# Altium project Main_Board_2.0.PrjPcb (part 1 of 4)
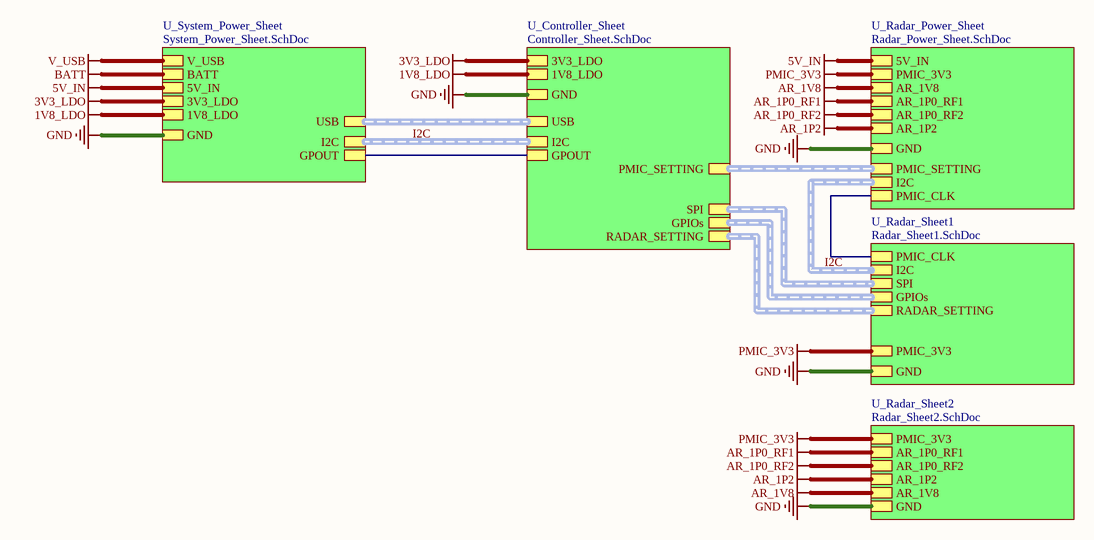
[diagram p0: Top_Sheet.SchDoc]
6 sheets, 225 parts. Net scope: hierarchical (ports join the sheet entries above them; power ports are global).
Board file: PCB_Main_Board_v2.0.PcbDoc
Sheets:
  Top_Sheet.SchDoc
    U_Radar_Power_Sheet = Radar_Power_Sheet.SchDoc
    U_Radar_Sheet2 = Radar_Sheet2.SchDoc
    U_System_Power_Sheet = System_Power_Sheet.SchDoc
    U_Controller_Sheet = Controller_Sheet.SchDoc
    U_Radar_Sheet1 = Radar_Sheet1.SchDoc

## Sheet Top_Sheet.SchDoc
size 420 x 297 mm; SheetNumber: 1; SheetTotal: 6

### Sub-sheets
U_Controller_Sheet = Controller_Sheet.SchDoc: USB (harness USB), GND, 3V3_LDO, 1V8_LDO, GPIOs (harness GPIOs), SPI (harness SPI), PMIC_SETTING (harness PMIC_SETTING), GPOUT, RADAR_SETTING (harness RADAR_SETTING), I2C (harness I2C)
U_Radar_Power_Sheet = Radar_Power_Sheet.SchDoc: I2C (harness I2C), GND, 5V_IN, AR_1P0_RF1, PMIC_3V3, AR_1P2, AR_1P0_RF2, AR_1V8, PMIC_SETTING (harness PMIC_SETTING), PMIC_CLK
U_Radar_Sheet1 = Radar_Sheet1.SchDoc: GPIOs (harness GPIOs), I2C (harness I2C), SPI (harness SPI), PMIC_3V3, GND, PMIC_CLK, RADAR_SETTING (harness RADAR_SETTING)
U_Radar_Sheet2 = Radar_Sheet2.SchDoc: GND, AR_1P0_RF1, PMIC_3V3, AR_1P2, AR_1P0_RF2, AR_1V8
U_System_Power_Sheet = System_Power_Sheet.SchDoc: USB (harness USB), I2C (harness I2C), GND, BATT, V_USB, 3V3_LDO, 5V_IN, 1V8_LDO, GPOUT

### Nets
1V8_LDO: sheet U_System_Power_Sheet/1V8_LDO, sheet U_Controller_Sheet/1V8_LDO
3V3_LDO: sheet U_System_Power_Sheet/3V3_LDO, sheet U_Controller_Sheet/3V3_LDO
5V_IN: sheet U_Radar_Power_Sheet/5V_IN, sheet U_System_Power_Sheet/5V_IN
AR_1P0_RF1: sheet U_Radar_Power_Sheet/AR_1P0_RF1, sheet U_Radar_Sheet2/AR_1P0_RF1
AR_1P0_RF2: sheet U_Radar_Power_Sheet/AR_1P0_RF2, sheet U_Radar_Sheet2/AR_1P0_RF2
AR_1P2: sheet U_Radar_Power_Sheet/AR_1P2, sheet U_Radar_Sheet2/AR_1P2
AR_1V8: sheet U_Radar_Power_Sheet/AR_1V8, sheet U_Radar_Sheet2/AR_1V8
GND: sheet U_Radar_Power_Sheet/GND, sheet U_Radar_Sheet2/GND, sheet U_System_Power_Sheet/GND, sheet U_Controller_Sheet/GND, sheet U_Radar_Sheet1/GND
PMIC_3V3: sheet U_Radar_Power_Sheet/PMIC_3V3, sheet U_Radar_Sheet2/PMIC_3V3, sheet U_Radar_Sheet1/PMIC_3V3
GPOUT: sheet U_System_Power_Sheet/GPOUT, sheet U_Controller_Sheet/GPOUT
PMIC_CLK: sheet U_Radar_Power_Sheet/PMIC_CLK, sheet U_Radar_Sheet1/PMIC_CLK

### Buses and harness runs
harness I2C = sheet U_Controller_Sheet/I2C = sheet U_System_Power_Sheet/I2C
harness I2C = sheet U_Radar_Power_Sheet/I2C = sheet U_Radar_Sheet1/I2C
harness sheet U_Controller_Sheet/GPIOs = sheet U_Radar_Sheet1/GPIOs
harness sheet U_Controller_Sheet/PMIC_SETTING = sheet U_Radar_Power_Sheet/PMIC_SETTING
harness sheet U_Controller_Sheet/RADAR_SETTING = sheet U_Radar_Sheet1/RADAR_SETTING
harness sheet U_Controller_Sheet/SPI = sheet U_Radar_Sheet1/SPI
harness sheet U_Controller_Sheet/USB = sheet U_System_Power_Sheet/USB

### Notes on the sheet
- File:
- Title:
- Date:
- Page
- Num:
- Total:
- Drawn By: Huzaifa Ali

## Sheet Radar_Power_Sheet.SchDoc
size 420 x 297 mm; SheetNumber: 3; SheetTotal: 6
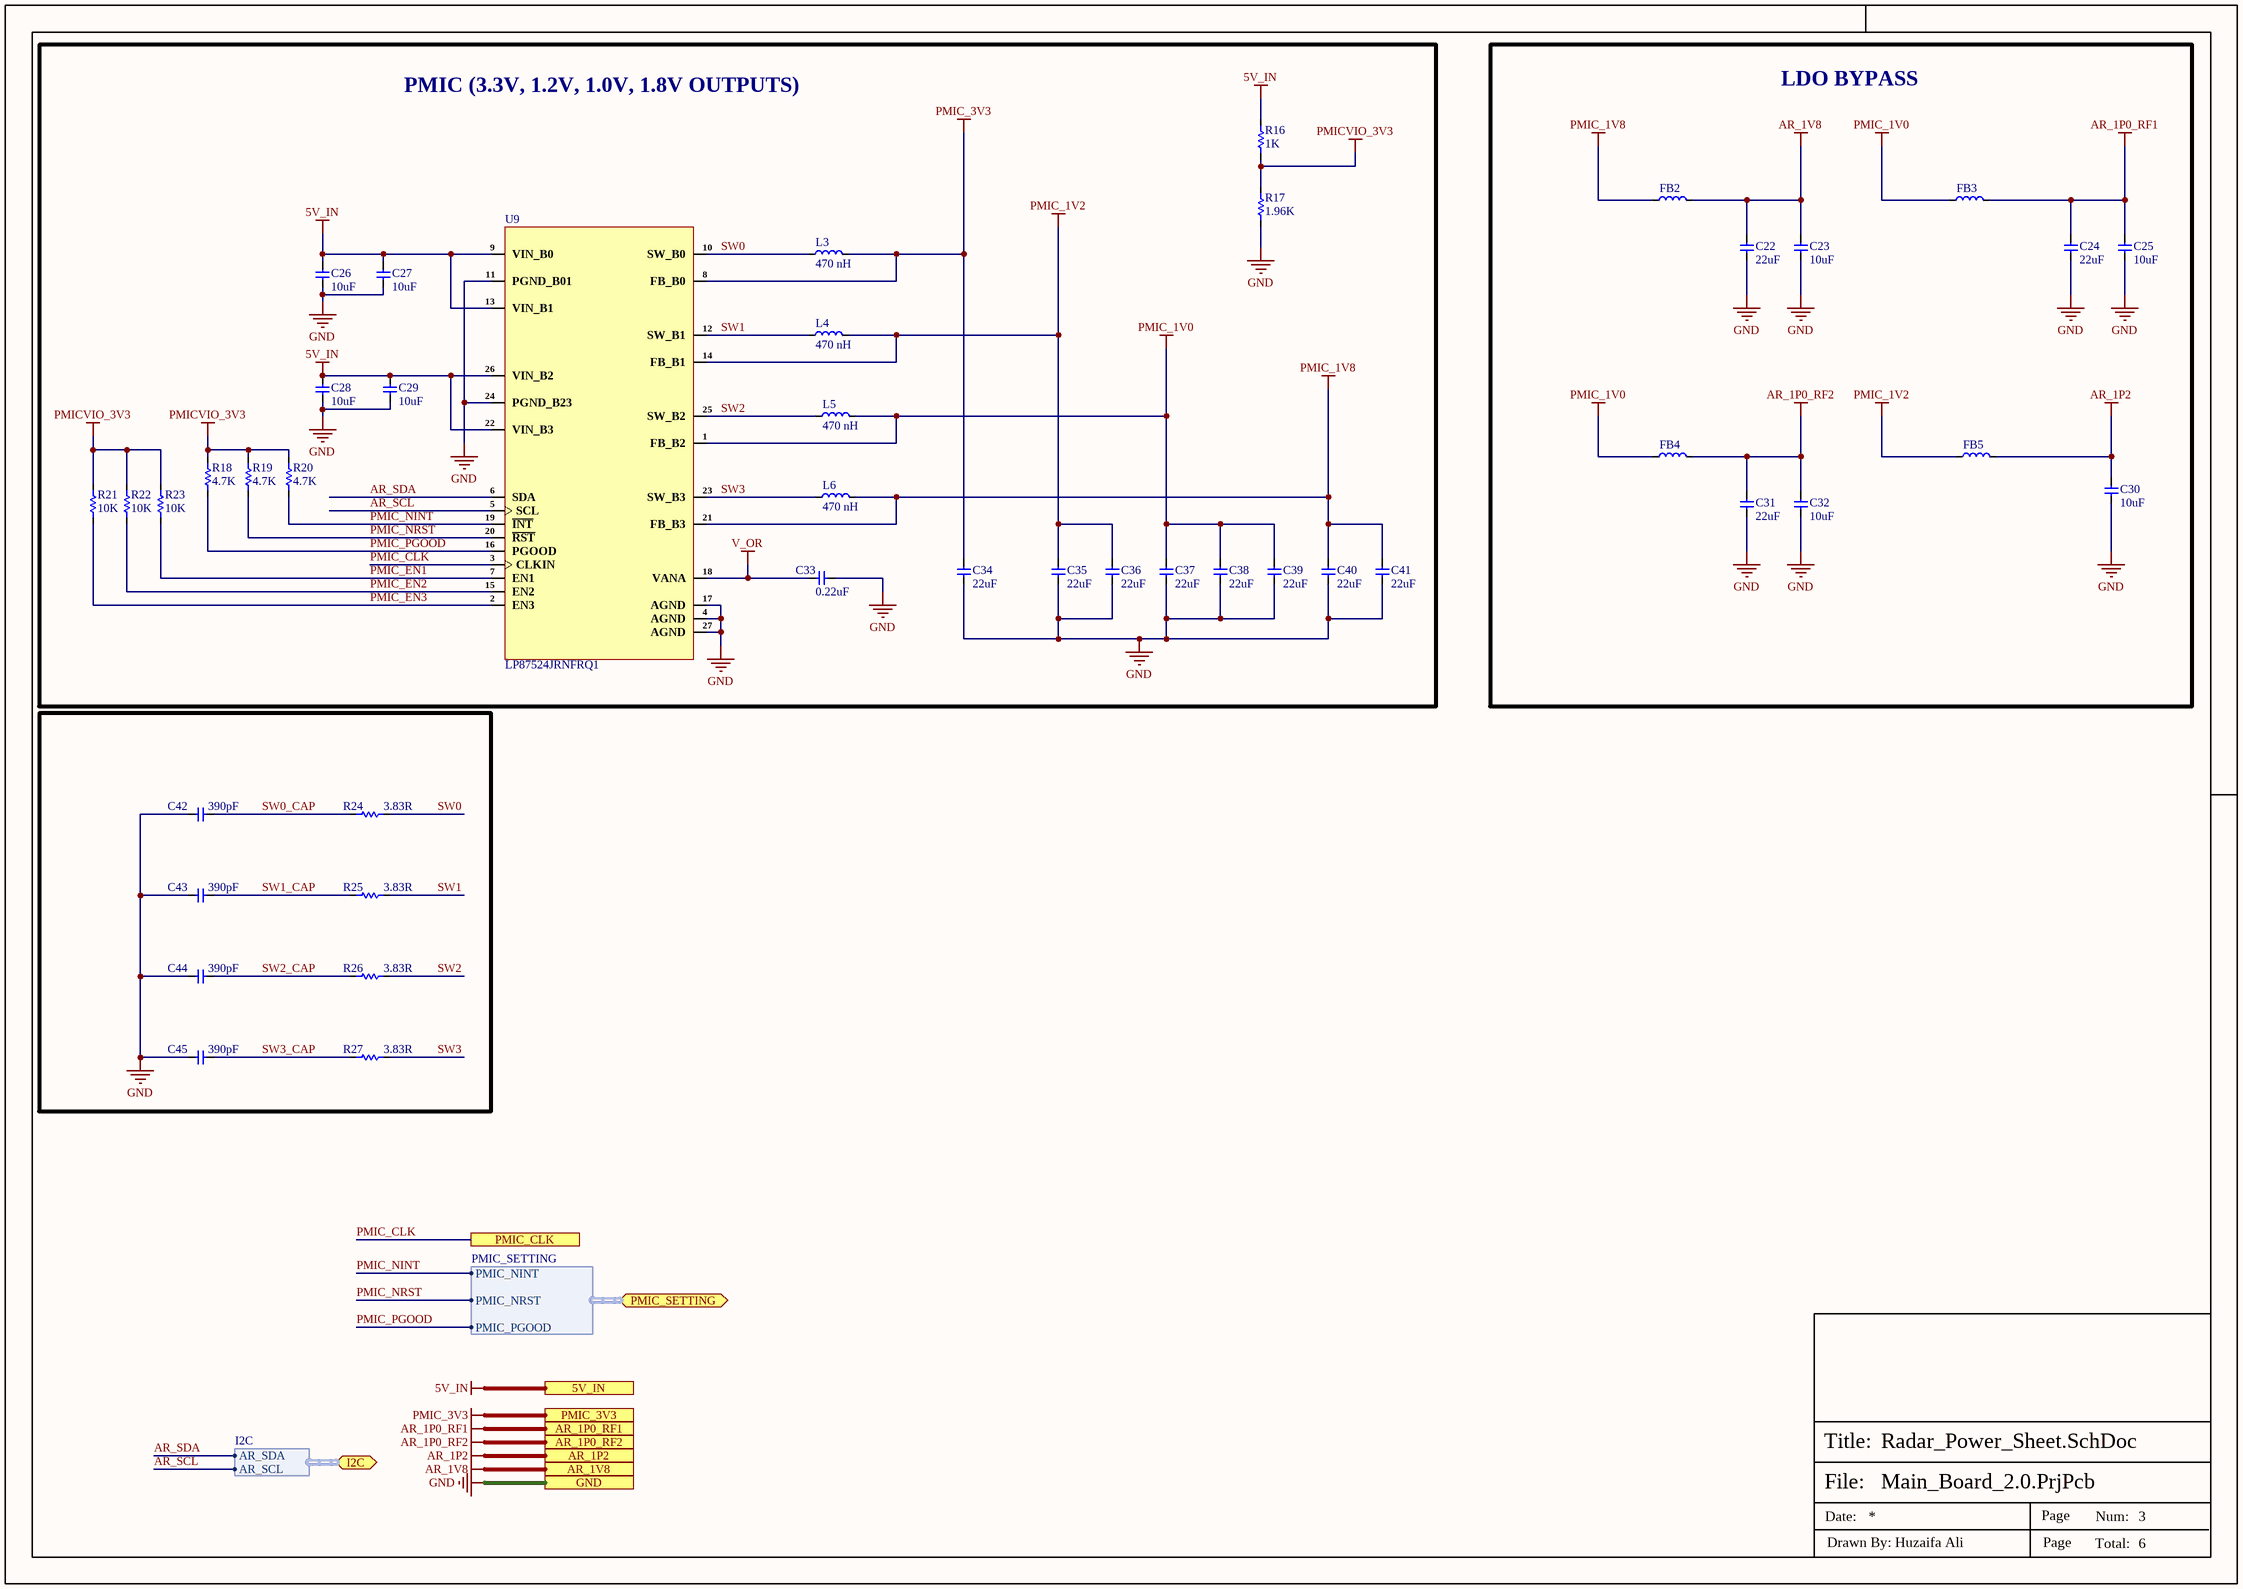
[diagram p1: Radar_Power_Sheet.SchDoc]

### Parts
C22  22uF  [Cap-1206]
C23  10uF  [Cap-0603]
C24  22uF  [Cap-1206]
C25  10uF  [Cap-0603]
C26  10uF  [Cap-0603]
C27  10uF  [Cap-0603]
C28  10uF  [Cap-0603]
C29  10uF  [Cap-0603]
C30  10uF  [Cap-0603]
C31  22uF  [Cap-1206]
C32  10uF  [Cap-0603]
C33  0.22uF  [Cap-0402]
C34  22uF  [Cap-1206]
C35  22uF  [Cap-1206]
C36  22uF  [Cap-1206]
C37  22uF  [Cap-1206]
C38  22uF  [Cap-1206]
C39  22uF  [Cap-1206]
C40  22uF  [Cap-1206]
C41  22uF  [Cap-1206]
C42  390pF  [Cap-0402]
C43  390pF  [Cap-0402]
C44  390pF  [Cap-0402]
C45  390pF  [Cap-0402]
FB2  100MHz  [IND-0603 (1608 Metric)]  (value not drawn)
FB3  100MHz  [IND-0603 (1608 Metric)]  (value not drawn)
FB4  100MHz  [IND-0603 (1608 Metric)]  (value not drawn)
FB5  100MHz  [IND-0603 (1608 Metric)]  (value not drawn)
L3  470 nH  [IND-1008 (2520 Metric)]
L4  470 nH  [IND-1008 (2520 Metric)]
L5  470 nH  [IND-1008 (2520 Metric)]
L6  470 nH  [IND-1008 (2520 Metric)]
R16  1K  [Res-0201]
R17  1.96K  [Res-0603]
R18  4.7K  [Res-0402]
R19  4.7K  [Res-0402]
R20  4.7K  [Res-0402]
R21  10K  [Res-0402]
R22  10K  [Res-0402]
R23  10K  [Res-0402]
R24  3.83R  [Res-0402]
R25  3.83R  [Res-0402]
R26  3.83R  [Res-0402]
R27  3.83R  [Res-0402]
U9  LP87524JRNFRQ1  [26-VQFN-HR (4.5x4)]

### Blocks framed on the sheet
PMIC (3.3V, 1.2V, 1.0V, 1.8V OUTPUTS): C26-C29 C33-C41 L3-L6 R16-R23 U9
LDO BYPASS: C22-C25 C30-C32 FB2-FB5

### Ports
5V_IN, AR_1P0_RF1, AR_1P0_RF2, AR_1P2, AR_1V8, GND, I2C (bidir, harness I2C), PMIC_3V3, PMIC_CLK, PMIC_SETTING (bidir, harness PMIC_SETTING)

### Harnesses
I2C: AR_SDA, AR_SCL
PMIC_SETTING: PMIC_NINT, PMIC_NRST, PMIC_PGOOD

### Nets
5V_IN: C26.2 C27.2 C28.2 C29.2 R16.1 U9.9(VIN_B0) U9.13(VIN_B1) U9.22(VIN_B3) U9.26(VIN_B2) ; port 5V_IN
AR_1P0_RF1: C24.2 C25.2 FB3.2 ; port AR_1P0_RF1
AR_1P0_RF2: C31.2 C32.2 FB4.2 ; port AR_1P0_RF2
AR_1P2: C30.2 FB5.2 ; port AR_1P2
AR_1V8: C22.2 C23.2 FB2.2 ; port AR_1V8
GND: C22.1 C23.1 C24.1 C25.1 C26.1 C27.1 C28.1 C29.1 C30.1 C31.1 C32.1 C33.2 C34.1 C35.1 C36.1 C37.1 C38.1 C39.1 C40.1 C41.1 C42.1 C43.1 C44.1 C45.1 R17.1 U9.4(AGND) U9.11(PGND_B01) U9.17(AGND) U9.24(PGND_B23) U9.27(AGND) ; port GND
PMIC_1V0: C37.2 C38.2 C39.2 FB3.1 FB4.1 L5.2 U9.1(FB_B2)
PMIC_1V2: C35.2 C36.2 FB5.1 L4.2 U9.14(FB_B1)
PMIC_1V8: C40.2 C41.2 FB2.1 L6.2 U9.21(FB_B3)
PMIC_3V3: C34.2 L3.2 U9.8(FB_B0) ; port PMIC_3V3
PMICVIO_3V3: R16.2 R17.2 R18.2 R19.2 R20.2 R21.2 R22.2 R23.2
V_OR: C33.1 U9.18(VANA)
AR_SCL: U9.5(SCL) ; port I2C.AR_SCL
AR_SDA: U9.6(SDA) ; port I2C.AR_SDA
PMIC_CLK: U9.3(CLKIN) ; port PMIC_CLK
PMIC_EN1: R23.1 U9.7(EN1)
PMIC_EN2: R22.1 U9.15(EN2)
PMIC_EN3: R21.1 U9.2(EN3)
PMIC_NINT: R20.1 U9.19(~{INT}) ; port PMIC_SETTING.PMIC_NINT
PMIC_NRST: R19.1 U9.20(~{RST}) ; port PMIC_SETTING.PMIC_NRST
PMIC_PGOOD: R18.1 U9.16(PGOOD) ; port PMIC_SETTING.PMIC_PGOOD
SW0: L3.1 R24.2 U9.10(SW_B0)
SW0_CAP: C42.2 R24.1
SW1: L4.1 R25.2 U9.12(SW_B1)
SW1_CAP: C43.2 R25.1
SW2: L5.1 R26.2 U9.25(SW_B2)
SW2_CAP: C44.2 R26.1
SW3: L6.1 R27.2 U9.23(SW_B3)
SW3_CAP: C45.2 R27.1

### Notes on the sheet
- File:
- Title:
- Date:
- Page
- Num:
- Total:
- Drawn By: Huzaifa Ali

### Library data of the parts
C22 C24 C31 C34-C41 = C3216X5R1E226M160AB: CAP CER 22UF 25V X5R 1206; Manufacturer: TDK; Dielectric Material: Ceramic; Tolerance: 20%; Item Type: Capacitor; Supplier 1: Digi-Key; Manufacturer Part Number: C3216X5R1E226M160AB; Stock 1: 21442; Pricing 1: 1=1.08, 10=0.822, 50=0.6832, 100=0.5882, 500=0.4554, 1000=0.39215 (USD); Mount: Surface Mount; Case/Package: 1206; Case Code (Metric): 3216; Case Code (Imperial): 1206; Weight: 0.000571oz; Min Operating Temperature: -55°C; Max Operating Temperature: 85°C; Voltage Rating: 25V; Capacitance: 22uF; Packaging: Tape and Reel; Voltage Rating (DC): 25V; Dielectric: X5R; Termination: SMD/SMT; Construction: Flat; Package Quantity: 1; Resistor Type: Ceramic; Series: C; Length: 3.2mm; Width: 0.063inch; Height: 1.6mm; Depth: 1.6mm; Thickness: 0.071inch; Lead Free: Lead Free; REACH SVHC: No SVHC; RoHS Compliant: Yes; ComponentLink1URL: https://product.tdk.com/info/en/documents/chara_sheet/C3216X5R1E226M160AB.pdf?src-supplier=Digi-Key; ComponentLink1Description: https://product.tdk.com/info/en/documents/chara_sheet/C3216X5R1E226M160AB.pdf?src-supplier=Digi-Key; ComponentLink2URL: http://www.mouser.com/ds/2/400/lcc_commercial_general_en-837201.pdf?src-supplier=Mouser; ComponentLink2Description: http://www.mouser.com/ds/2/400/lcc_commercial_general_en-837201.pdf?src-supplier=Mouser; Supplier Part Number 1: 445-6000-1-ND; LCSC Part Number: C2167811
C23 C25-C30 C32 = CC0603KRX5R7BB106: CAP CER 10UF 16V X5R 0603; Manufacturer: Yageo; Tolerance: 10%; Item Type: Capacitor; Supplier 1: Digi-Key; Manufacturer Part Number: CC0603KRX5R7BB106; RoHS: Yes; Category: Ceramic Capacitors; Stock 1: 240725; Pricing 1: 1=0.68000, 10=0.48000, 50=0.36300, 100=0.31610, 500=0.23416, 1000=0.19903 (USD); Mount: Surface Mount; Case/Package: 0603; Case Code (Imperial): 0603; Case Code (Metric): 1608; Min Operating Temperature: -55°C; Max Operating Temperature: 85°C; Packaging: Cut Tape; Capacitance: 10uF; Voltage Rating: 16V; RoHS Compliant: Yes; ComponentLink1URL: http://www.yageo.com/documents/recent/UPY-GPHC_X5R_4V-to-50V_25.pdf?src-supplier=Digi-Key; ComponentLink1Description: http://www.yageo.com/documents/recent/UPY-GPHC_X5R_4V-to-50V_25.pdf?src-supplier=Digi-Key; Supplier Part Number 1: 311-3486-1-ND; LCSC Part Number: C2936601
C33 = CC0402KRX5R8BB224: CAP CER 0.22UF 25V X5R 0402; Manufacturer: Yageo; Capacitance: 220nF; Tolerance: 10%; Supplier 1: Mouser; Manufacturer Part Number: CC0402KRX5R8BB224; RoHS: Yes; Category: Ceramic Capacitors; Stock 1: 61266; Pricing 1: 1=0.10000, 10=0.03300, 50=0.03300, 100=0.02700, 1000=0.01500, 10000=0.01300 (USD); Mount: Surface Mount; Case/Package: 0402; Min Operating Temperature: -55°C; Max Operating Temperature: 85°C; Packaging: Tape and Reel; Voltage Rating: 25V; Voltage Rating (DC): 25V; Dielectric: X5R; Length: 0.039inch; Width: 0.02inch; Thickness: 0.022inch; Lead Free: Lead Free; Halogen Free: Halogen Free; RoHS Compliant: Yes; ComponentLink1URL: http://www.yageo.com/documents/recent/UPY-GPHC_X5R_4V-to-50V_25.pdf?src-supplier=Digi-Key; ComponentLink1Description: http://www.yageo.com/documents/recent/UPY-GPHC_X5R_4V-to-50V_25.pdf?src-supplier=Digi-Key; ComponentLink2URL: https://www.yageo.com/upload/media/product/productsearch/datasheet/mlcc/UPY-GPHC_X5R_4V-to-50V_26.pdf?src-supplier=Digi-Key; ComponentLink2Description: https://www.yageo.com/upload/media/product/productsearch/datasheet/mlcc/UPY-GPHC_X5R_4V-to-50V_26.pdf?src-supplier=Digi-Key; ComponentLink3URL: http://www.yageo.com/documents/recent/UPY-GPHC_X5R_4V-to-50V_23.pdf?src-supplier=Digi-Key; ComponentLink3Description: http://www.yageo.com/documents/recent/UPY-GPHC_X5R_4V-to-50V_23.pdf?src-supplier=Digi-Key; Supplier Part Number 1: 603-CC402KRX5R8BB224; LCSC Part Number: C326836
C42-C45 = CGA2B2C0G1H391J050BA: CAP CER 390PF 50V C0G 0402; Manufacturer: TDK; Item Type: apacitors; Supplier: Digikey; Supplier Part Number: 445-5603-1-ND; Manufacturer Part Number: CGA2B2C0G1H391J050BA; RoHS: Yes; Stock: 103846; Pricing: 1=0.1, 10=0.048, 50=0.0278, 100=0.0216, 500=0.01622, 1000=0.01275, 2500=0.01159, 5000=0.01066 (USD); ComponentLink1URL: https://datasheet.ciiva.com/24219/cga2b2c0g1h391j050ba-265720-24219960.pdf?src-supplier=Mouser; ComponentLink1Description: https://datasheet.ciiva.com/24219/cga2b2c0g1h391j050ba-265720-24219960.pdf?src-supplier=Mouser; ComponentLink2URL: https://datasheet.ciiva.com/7975/1807242-7975259.pdf?src-supplier=Element14; ComponentLink2Description: https://datasheet.ciiva.com/7975/1807242-7975259.pdf?src-supplier=Element14
FB2-FB5 = BLM18SP101SZ1D: FERRITE BEAD 100 OHM 0603 1LN; Manufacturer: Murata; Max Current Rating: 3.7A; Number of Lines: 1; Supplier: Rs; Supplier Part Number: 2234942; Manufacturer Part Number: BLM18SP101SZ1D; RoHS: Yes; Category: Ferrite Beads and Chips; Stock: 1800; Pricing: 100=0.065, 500=0.059, 1000=0.048, 2000=0.044 (GBP); Mounting Technology: Surface Mount; Case/Package: 0603; Min Operating Temperature: -55°C; Max Operating Temperature: 125°C; Series: BLM; Ratings: AEC-Q200; LCSC Part Number: C1512136; Item Type: Ferrite Bead
L3-L6 = DFE252012PD-R47M=P2: FIXED IND 470NH 4A 0.027OHM SMD; Manufacturer: Murata; Item Type: Fixed Inductors; Inductance Tolerance: 20%; Saturation Current: 5.2A; ESR: 27mR; Test Frequency: 1MHz; Supplier: Mouser; Supplier Part Number: 81-DFE252012PDR47MP2; Manufacturer Part Number: DFE252012PD-R47M=P2; RoHS: Yes; Stock: 74061; Pricing: 1=0.48, 10=0.342, 50=0.342, 100=0.249, 1000=0.217, 10000=0.201 (USD); Min Operating Temperature: -40°C; Max Operating Temperature: 125°C; Current Rating: 4A; Value: 470nH; RMS Current (Irms): 4A; Tolerance: 20%; Height: 1.2mm; RoHS Compliant: Yes; ComponentLink1URL: http://www.farnell.com/datasheets/2616814.pdf?src-supplier=Farnell; ComponentLink1Description: http://www.farnell.com/datasheets/2616814.pdf?src-supplier=Farnell; ComponentLink2URL: https://search.murata.co.jp/Ceramy/image/img/P02/J(E)TE243A-9102.pdf?src-supplier=Digikey; ComponentLink2Description: https://search.murata.co.jp/Ceramy/image/img/P02/J(E)TE243A-9102.pdf?src-supplier=Digikey; ComponentLink3URL: http://www.farnell.com/datasheets/2616814.pdf?src-supplier=Newark; ComponentLink3Description: http://www.farnell.com/datasheets/2616814.pdf?src-supplier=Newark
R16 = RC0201FR-071KL: RES 1K OHM 1% 1/20W 0201; Manufacturer: Yageo; Value: 1kR; Temperature Coefficient: 200ppm/°C; Power Rating: 50mW; Voltage Rating: 25V; Item Type: Resistor; Supplier: Digi-Key; Supplier Part Number: 311-1KMCT-ND; Manufacturer Part Number: RC0201FR-071KL; RoHS: Yes; Category: Chip SMD Resistors; Stock: 5606340; Pricing: 1=0.1, 10=0.027, 50=0.0172, 100=0.0143, 500=0.00988, 1000=0.00854, 5000=0.00629 (USD); Case/Package: 0201; Contact Plating: Tin,Matte; Case Code (Metric): 0603; Case Code (Imperial): 0201; Min Operating Temperature: -55°C; Max Operating Temperature: 125°C; Tolerance: 1%; Resistor Type: Thick Film; Package Quantity: 10000; Packaging: Tape and Reel; Number of Terminations: 2; Termination: SMD/SMT; Max Power Dissipation: 50mW; Working Voltage: 25V; Features: Moisture Resistant; Series: RC; Resistance Tolerance: 1%; Technology: THICK FILM; Construction: Rectangular; Voltage Rating (DC): 25V; Length: 0.024inch; Width: 0.012inch; Height: 0.01inch; Depth: 0.3mm; Military Standard: Not; RoHS Compliant: Yes; Reach SVHC Compliant: Unknown; Lead Free: 5697LeadFree; ComponentLink1URL: https://datasheet.ciiva.com/7672/1563626-7672204.pdf?src-supplier=Element14; ComponentLink1Description: https://datasheet.ciiva.com/7672/1563626-7672204.pdf?src-supplier=Element14; ComponentLink2URL: https://datasheet.ciiva.com/22698/1563626-22698505.pdf?src-supplier=Element14; ComponentLink2Description: https://datasheet.ciiva.com/22698/1563626-22698505.pdf?src-supplier=Element14; ComponentLink3URL: https://datasheet.ciiva.com/29721/pyu-r-int-thick-7-29721196.pdf?src-supplier=Digi-Key; ComponentLink3Description: https://datasheet.ciiva.com/29721/pyu-r-int-thick-7-29721196.pdf?src-supplier=Digi-Key; ComponentLink4URL: https://datasheet.ciiva.com/29721/pyu-r-int-thick-7-29721195.pdf?src-supplier=Digi-Key; ComponentLink4Description: https://datasheet.ciiva.com/29721/pyu-r-int-thick-7-29721195.pdf?src-supplier=Digi-Key; ComponentLink5URL: https://datasheet.ciiva.com/8896/pyu-rc0201-51-rohs-l-8-8896174.pdf?src-supplier=Avnet; ComponentLink5Description: https://datasheet.ciiva.com/8896/pyu-rc0201-51-rohs-l-8-8896174.pdf?src-supplier=Avnet; LCSC Part Number: C138165
R17 = RC0603FR-071K96L: RES 1.96K OHM 1% 1/10W 0603; Manufacturer: Yageo; Value: 1.96kR; Power Rating: 100mW; Voltage Rating: 75V; Temperature Coefficient: 100ppm/°C; Voltage Rating (DC): 50V; Supplier: Future Electronics; Supplier Part Number: 4765236; Manufacturer Part Number: RC0603FR-071K96L; RoHS: Yes; Category: Chip SMD Resistors; Stock: 30000; Pricing: 5000=0.0015, 50000=0.0014, 150000=0.0014, 375000=0.0013, 1000000=0.0012 (USD); Case/Package: 0603; Case Code (Metric): 1608; Case Code (Imperial): 0603; Weight: 7.1E-05oz; Min Operating Temperature: -55°C; Max Operating Temperature: 155°C; Tolerance: 1%; Packaging: Tape and Reel; Number of Terminations: 2; Termination: SMD/SMT; Max Power Dissipation: 100mW; Features: Moisture Resistant; Series: RC; Construction: Rectangular; Length: 1.6mm; Width: 0.8mm; Height: 0.45mm; Depth: 0.8mm; Military Standard: Not; Lead Free: Lead Free; RoHS Compliant: Yes; ComponentLink1URL: https://datasheet.ciiva.com/2508/pyu-r-int-thick-7-2508485.pdf?src-supplier=Digikey; ComponentLink1Description: https://datasheet.ciiva.com/2508/pyu-r-int-thick-7-2508485.pdf?src-supplier=Digikey; ComponentLink2URL: https://datasheet.ciiva.com/2508/pyu-r-int-thick-7-2508486.pdf?src-supplier=Digikey; ComponentLink2Description: https://datasheet.ciiva.com/2508/pyu-r-int-thick-7-2508486.pdf?src-supplier=Digikey; ComponentLink3URL: https://datasheet.ciiva.com/2508/pyu-r-int-thick-7-2508487.pdf?src-supplier=Digikey; ComponentLink3Description: https://datasheet.ciiva.com/2508/pyu-r-int-thick-7-2508487.pdf?src-supplier=Digikey; ComponentLink4URL: https://datasheet.ciiva.com/15189/getdatasheetpartid-327907-15189642.pdf?src-supplier=Verical; ComponentLink4Description: https://datasheet.ciiva.com/15189/getdatasheetpartid-327907-15189642.pdf?src-supplier=Verical
R18-R20 = RC0402FR-074K7L: RES 4.7K OHM 1% 1/16W 0402; Manufacturer: Yageo; Voltage Rating (DC): 50V; Power Rating: 62.5mW; Resistance: 4.7kR; Temperature Coefficient: 100ppm/°C; Max Power Dissipation: 63mW; Item Type: Resistor; Supplier 1: Avnet; Manufacturer Part Number: RC0402FR-074K7L; RoHS: Yes; Category: Chip SMD Resistors; Stock 1: 2420000; Pricing 1: 10000=0.00085 (USD); Case/Package: 0402; Number of Pins: 2; Case Code (Imperial): 0402; Case Code (Metric): 1005; Size Code: 0402; Min Operating Temperature: -55°C; Max Operating Temperature: 155°C; Tolerance: 1%; Voltage Rating: 50V; Packaging: Tape and Reel; Resistor Type: Thick Film; Termination: SMD/SMT; Features: Moisture Resistant; Series: RC; Number of Terminations: 2; Resistance Tolerance: 1%; Construction: Rectangular; Length: 1mm; Width: 0.5mm; Height: 0.32mm; Depth: 0.5mm; Height - Seated (Max): 0.016inch; RoHS Compliant: Yes; Reach SVHC Compliant: Yes; Military Standard: Not; Lead Free: Lead Free; ComponentLink1URL: https://datasheet.ciiva.com/22661/1686128-22661342.pdf?src-supplier=Element14; ComponentLink1Description: https://datasheet.ciiva.com/22661/1686128-22661342.pdf?src-supplier=Element14; ComponentLink2URL: https://datasheet.ciiva.com/7850/1018594-7850022.pdf?src-supplier=Element14; ComponentLink2Description: https://datasheet.ciiva.com/7850/1018594-7850022.pdf?src-supplier=Element14; ComponentLink3URL: https://datasheet.ciiva.com/7850/1018594-7850023.pdf?src-supplier=Element14; ComponentLink3Description: https://datasheet.ciiva.com/7850/1018594-7850023.pdf?src-supplier=Element14; ComponentLink4URL: https://datasheet.ciiva.com/15215/getdatasheetpartid-328119-15215035.pdf?src-supplier=Verical; ComponentLink4Description: https://datasheet.ciiva.com/15215/getdatasheetpartid-328119-15215035.pdf?src-supplier=Verical; Supplier Part Number 1: RC0402FR-074K7L; LCSC Part Number: C105871
R21-R23 = RC0402FR-0710KL: RES 10K OHM 1% 1/16W 0402; Manufacturer: Yageo; Resistance: 10kR; Voltage Rating (DC): 50V; Temperature Coefficient: 100ppm/°C; Power Rating: 62.5mW; Max Power Dissipation: 63mW; Item Type: Resistor; Supplier 1: Mouser; Manufacturer Part Number: RC0402FR-0710KL; RoHS: Yes; Category: Chip SMD Resistors; Stock 1: 18648329; Pricing 1: 1=0.10000, 10=0.01400, 50=0.01400, 100=0.00500, 1000=0.00300, 10000=0.00200 (USD); Case/Package: 0402; Number of Pins: 2; Case Code (Imperial): 0402; Case Code (Metric): 1005; Min Operating Temperature: -55°C; Max Operating Temperature: 155°C; Resistor Type: Thick Film; Tolerance: 1%; Packaging: Tape and Reel; Voltage Rating: 50V; Termination: SMD/SMT; Working Voltage: 50V; Number of Terminations: 2; Features: Moisture Resistant; Series: RC; Resistance Tolerance: 1%; Construction: Rectangular; Length: 1mm; Width: 0.5mm; Height: 0.32mm; Depth: 0.5mm; Lead Pitch: 0.2mm; REACH SVHC: No SVHC; Lead Free: Lead Free; RoHS Compliant: Yes; Military Standard: Not; ComponentLink1URL: https://datasheet.ciiva.com/7660/38568-7660787.pdf?src-supplier=Element14; ComponentLink1Description: https://datasheet.ciiva.com/7660/38568-7660787.pdf?src-supplier=Element14; ComponentLink2URL: https://datasheet.ciiva.com/7849/1686128-7849814.pdf?src-supplier=Element14; ComponentLink2Description: https://datasheet.ciiva.com/7849/1686128-7849814.pdf?src-supplier=Element14; ComponentLink3URL: https://datasheet.ciiva.com/7983/1018594-7983486.pdf?src-supplier=Element14; ComponentLink3Description: https://datasheet.ciiva.com/7983/1018594-7983486.pdf?src-supplier=Element14; ComponentLink4URL: https://datasheet.ciiva.com/22747/1018594-22747512.pdf?src-supplier=Element14; ComponentLink4Description: https://datasheet.ciiva.com/22747/1018594-22747512.pdf?src-supplier=Element14; ComponentLink5URL: https://datasheet.ciiva.com/12667/pyu-rc0402-51-rohs-l-6-r-12667067.pdf?src-supplier=Mouser; ComponentLink5Description: https://datasheet.ciiva.com/12667/pyu-rc0402-51-rohs-l-6-r-12667067.pdf?src-supplier=Mouser; ComponentLink6URL: https://datasheet.ciiva.com/7849/1784430-7849813.pdf?src-supplier=Element14; ComponentLink6Description: https://datasheet.ciiva.com/7849/1784430-7849813.pdf?src-supplier=Element14; ComponentLink7URL: https://datasheet.ciiva.com/7849/1784430-7849815.pdf?src-supplier=Element14; ComponentLink7Description: https://datasheet.ciiva.com/7849/1784430-7849815.pdf?src-supplier=Element14; Supplier Part Number 1: 603-RC0402FR-0710KL; LCSC Part Number: C60490
R24-R27 = CRCW04023R83FKED: RES SMD 3.83 OHM 1% 1/16W 0402; Manufacturer: Vishay Dale; Item Type: Resistors; Voltage Rating (DC): 50V; Supplier: Mouser; Supplier Part Number: 71-CRCW04023R83FKED; Manufacturer Part Number: CRCW04023R83FKED; RoHS: Yes; Stock: 23660; Pricing: 1=0.1, 10=0.023, 50=0.023, 100=0.013, 1000=0.01, 10000=0.005 (USD); ComponentLink1URL: https://datasheet.ciiva.com/2464/dcrcwe3-2464766.pdf?src-supplier=Digikey; ComponentLink1Description: https://datasheet.ciiva.com/2464/dcrcwe3-2464766.pdf?src-supplier=Digikey; ComponentLink2URL: https://datasheet.ciiva.com/2464/dcrcwe3-2464767.pdf?src-supplier=Digikey; ComponentLink2Description: https://datasheet.ciiva.com/2464/dcrcwe3-2464767.pdf?src-supplier=Digikey; ComponentLink3URL: https://datasheet.ciiva.com/2464/dcrcwe3-2464765.pdf?src-supplier=Digikey; ComponentLink3Description: https://datasheet.ciiva.com/2464/dcrcwe3-2464765.pdf?src-supplier=Digikey; ComponentLink4URL: https://datasheet.ciiva.com/9076/dcrcwe3-9076442.pdf?src-supplier=Avnet; ComponentLink4Description: https://datasheet.ciiva.com/9076/dcrcwe3-9076442.pdf?src-supplier=Avnet
U9 = LP87524JRNFRQ1: IC REG BUCK ADJ QUAD 26VQFN; Manufacturer: Texas Instruments; Supplier: Mouser; Supplier Part Number: 595-LP87524JRNFRQ1; Manufacturer Part Number: LP87524JRNFRQ1; RoHS: Yes; Item Type: IC; Stock: 3780; Pricing: 1=5.94, 10=5.2, 50=5.2, 100=4.37, 1000=3.14, 10000=2.91 (USD); Pins: 26NUMBER; Thickness: 900um; ComponentLink1URL: http://www.ti.com/general/docs/suppproductinfo.tsp?distId=10&amp;gotoUrl=http%3A%2F%2Fwww.ti.com%2Flit%2Fgpn%2Flp87524j-q1&src-supplier=Digikey; ComponentLink1Description: http://www.ti.com/general/docs/suppproductinfo.tsp?distId=10&amp;gotoUrl=http%3A%2F%2Fwww.ti.com%2Flit%2Fgpn%2Flp87524j-q1&src-supplier=Digikey

## Sheet Radar_Sheet2.SchDoc
size 420 x 297 mm; SheetNumber: 5; SheetTotal: 6
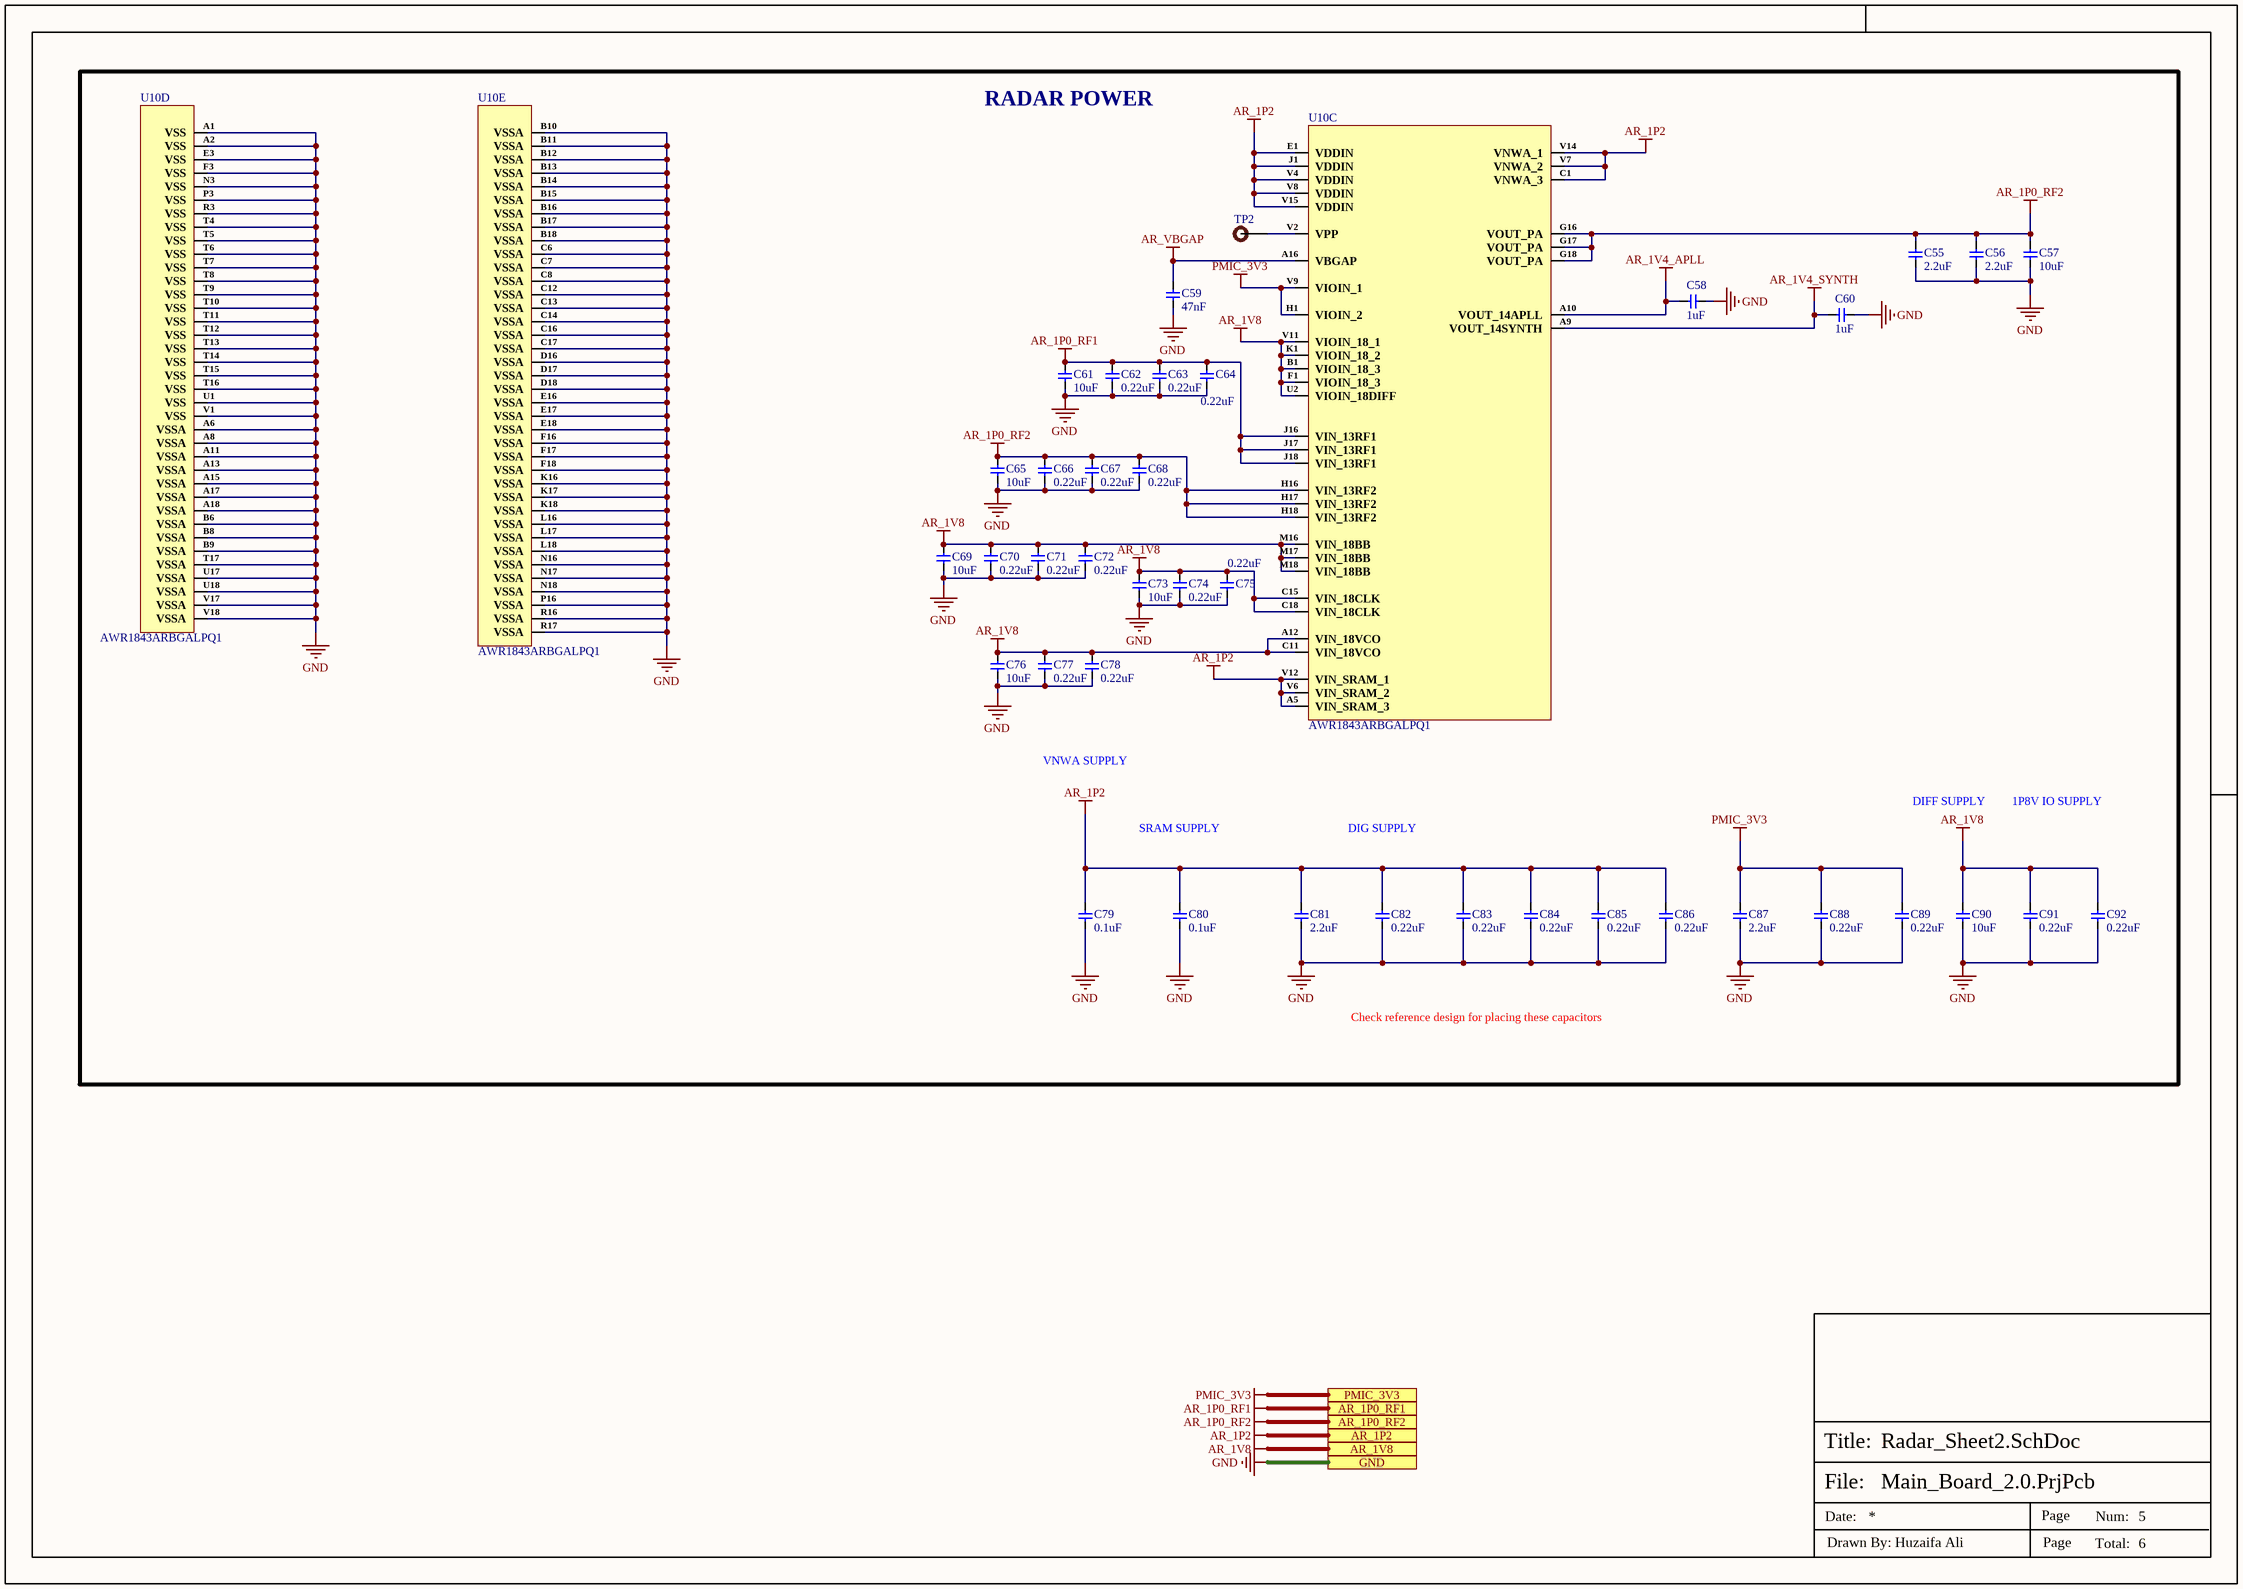
[diagram p2: Radar_Sheet2.SchDoc]

### Parts
C55  2.2uF  [CAP-0603]
C56  2.2uF  [CAP-0603]
C57  10uF  [Cap-0603]
C58  1uF  [Cap-0402]
C59  47nF  [Cap-0402]
C60  1uF  [Cap-0402]
C61  10uF  [Cap-0603]
C62  0.22uF  [Cap-0402]
C63  0.22uF  [Cap-0402]
C64  0.22uF  [Cap-0402]
C65  10uF  [Cap-0603]
C66  0.22uF  [Cap-0402]
C67  0.22uF  [Cap-0402]
C68  0.22uF  [Cap-0402]
C69  10uF  [Cap-0603]
C70  0.22uF  [Cap-0402]
C71  0.22uF  [Cap-0402]
C72  0.22uF  [Cap-0402]
C73  10uF  [Cap-0603]
C74  0.22uF  [Cap-0402]
C75  0.22uF  [Cap-0402]
C76  10uF  [Cap-0603]
C77  0.22uF  [Cap-0402]
C78  0.22uF  [Cap-0402]
C79  0.1uF  [Cap-0402]
C80  0.1uF  [Cap-0402]
C81  2.2uF  [CAP-0603]
C82  0.22uF  [Cap-0402]
C83  0.22uF  [Cap-0402]
C84  0.22uF  [Cap-0402]
C85  0.22uF  [Cap-0402]
C86  0.22uF  [Cap-0402]
C87  2.2uF  [CAP-0603]
C88  0.22uF  [Cap-0402]
C89  0.22uF  [Cap-0402]
C90  10uF  [Cap-0603]
C91  0.22uF  [Cap-0402]
C92  0.22uF  [Cap-0402]
TP2  TEST POINT  [Test-point]  (value not drawn)  (no BOM)
U10  AWR1843ARBGALPQ1  [180-FCBGA (15x15)]  (parts C,D,E of 5)

### Ports
AR_1P0_RF1, AR_1P0_RF2, AR_1P2, AR_1V8, GND, PMIC_3V3

### Nets
AR_1P0_RF1: C61.2 C62.2 C63.2 C64.2 U10.J16(VIN_13RF1) U10.J17(VIN_13RF1) U10.J18(VIN_13RF1) ; port AR_1P0_RF1
AR_1P0_RF2: C55.2 C56.2 C57.2 C65.2 C66.2 C67.2 C68.2 U10.G16(VOUT_PA) U10.G17(VOUT_PA) U10.G18(VOUT_PA) U10.H16(VIN_13RF2) U10.H17(VIN_13RF2) U10.H18(VIN_13RF2) ; port AR_1P0_RF2
AR_1P2: C79.2 C80.2 C81.2 C82.2 C83.2 C84.2 C85.2 C86.2 U10.A5(VIN_SRAM_3) U10.C1(VNWA_3) U10.E1(VDDIN) U10.J1(VDDIN) U10.V4(VDDIN) U10.V6(VIN_SRAM_2) U10.V7(VNWA_2) U10.V8(VDDIN) U10.V12(VIN_SRAM_1) U10.V14(VNWA_1) U10.V15(VDDIN) ; port AR_1P2
AR_1V4_APLL: C58.2 U10.A10(VOUT_14APLL)
AR_1V4_SYNTH: C60.2 U10.A9(VOUT_14SYNTH)
AR_1V8: C69.2 C70.2 C71.2 C72.2 C73.2 C74.2 C75.2 C76.2 C77.2 C78.2 C90.2 C91.2 C92.2 U10.A12(VIN_18VCO) U10.B1(VIOIN_18_3) U10.C11(VIN_18VCO) U10.C15(VIN_18CLK) U10.C18(VIN_18CLK) U10.F1(VIOIN_18_3) U10.K1(VIOIN_18_2) U10.M16(VIN_18BB) U10.M17(VIN_18BB) U10.M18(VIN_18BB) U10.U2(VIOIN_18DIFF) U10.V11(VIOIN_18_1) ; port AR_1V8
AR_VBGAP: C59.2 U10.A16(VBGAP)
GND: C55.1 C56.1 C57.1 C58.1 C59.1 C60.1 C61.1 C62.1 C63.1 C64.1 C65.1 C66.1 C67.1 C68.1 C69.1 C70.1 C71.1 C72.1 C73.1 C74.1 C75.1 C76.1 C77.1 C78.1 C79.1 C80.1 C81.1 C82.1 C83.1 C84.1 C85.1 C86.1 C87.1 C88.1 C89.1 C90.1 C91.1 C92.1 U10.A1(VSS) U10.A2(VSS) U10.A6(VSSA) U10.A8(VSSA) U10.A11(VSSA) U10.A13(VSSA) U10.A15(VSSA) U10.A17(VSSA) U10.A18(VSSA) U10.B6(VSSA) U10.B8(VSSA) U10.B9(VSSA) U10.B10(VSSA) U10.B11(VSSA) U10.B12(VSSA) U10.B13(VSSA) U10.B14(VSSA) U10.B15(VSSA) U10.B16(VSSA) U10.B17(VSSA) U10.B18(VSSA) U10.C6(VSSA) U10.C7(VSSA) U10.C8(VSSA) U10.C12(VSSA) U10.C13(VSSA) U10.C14(VSSA) U10.C16(VSSA) U10.C17(VSSA) U10.D16(VSSA) U10.D17(VSSA) U10.D18(VSSA) U10.E3(VSS) U10.E16(VSSA) U10.E17(VSSA) U10.E18(VSSA) U10.F3(VSS) U10.F16(VSSA) U10.F17(VSSA) U10.F18(VSSA) U10.K16(VSSA) U10.K17(VSSA) U10.K18(VSSA) U10.L16(VSSA) U10.L17(VSSA) U10.L18(VSSA) U10.N3(VSS) U10.N16(VSSA) U10.N17(VSSA) U10.N18(VSSA) U10.P3(VSS) U10.P16(VSSA) U10.R3(VSS) U10.R16(VSSA) U10.R17(VSSA) U10.T4(VSS) U10.T5(VSS) U10.T6(VSS) U10.T7(VSS) U10.T8(VSS) U10.T9(VSS) U10.T10(VSS) U10.T11(VSS) U10.T12(VSS) U10.T13(VSS) U10.T14(VSS) U10.T15(VSS) U10.T16(VSS) U10.T17(VSSA) U10.U1(VSS) U10.U17(VSSA) U10.U18(VSSA) U10.V1(VSS) U10.V17(VSSA) U10.V18(VSSA) ; port GND
PMIC_3V3: C87.2 C88.2 C89.2 U10.H1(VIOIN_2) U10.V9(VIOIN_1) ; port PMIC_3V3
NetTP2_1: TP2.1 U10.V2(VPP)

### Notes on the sheet
- RADAR POWER
- VNWA SUPPLY
- DIFF SUPPLY
- 1P8V IO SUPPLY
- SRAM SUPPLY
- DIG SUPPLY
- Check reference design for placing these capacitors
- File:
- Title:
- Date:
- Page
- Num:
- Total:
- Drawn By: Huzaifa Ali

### Library data of the parts
C55 C56 C81 C87 = CC0603KRX5R8BB225: CAP CER 2.2UF 25V X5R 0603; Manufacturer: Yageo; Tolerance: 10%; Item Type: Capacitor; Supplier 1: Digi-Key; Manufacturer Part Number: CC0603KRX5R8BB225; Stock 1: 687936; Pricing 1: 1=0.4, 10=0.276, 50=0.1932, 100=0.1656, 500=0.1242, 1000=0.10488 (USD); Mount: Surface Mount; Case/Package: 0603; Case Code (Metric): 1608; Case Code (Imperial): 0603; Weight: 7.1E-05oz; Min Operating Temperature: -55°C; Max Operating Temperature: 85°C; Packaging: Tape and Reel; Capacitance: 2.2uF; Dielectric: X5R; Voltage Rating: 25V; Termination: SMD/SMT; Resistor Type: Ceramic; Voltage Rating (DC): 25V; Package Quantity: 4000; Length: 1.6mm; Width: 0.031inch; Thickness: 0.037inch; Depth: 0.8mm; Radiation Hardening: No; Lead Free: Lead Free; Halogen Free: Halogen Free; RoHS Compliant: Yes; ComponentLink1URL: https://www.verical.com/server-webapp/html/getDatasheet?partID=782757&src-supplier=Verical; ComponentLink1Description: https://www.verical.com/server-webapp/html/getDatasheet?partID=782757&src-supplier=Verical; Supplier Part Number 1: 311-1786-1-ND; LCSC Part Number: C309478
C57 C61 C65 C69 C73 C76 C90 = CC0603KRX5R7BB106: as C23 on sheet Radar_Power_Sheet; Supplier 1: Digi-Key; Manufacturer Part Number: CC0603KRX5R7BB106; RoHS: Yes; Category: Ceramic Capacitors; Stock 1: 240725; Pricing 1: 1=0.68000, 10=0.48000, 50=0.36300, 100=0.31610, 500=0.23416, 1000=0.19903 (USD); Mount: Surface Mount; Case/Package: 0603; Case Code (Imperial): 0603; Case Code (Metric): 1608; Min Operating Temperature: -55°C; Max Operating Temperature: 85°C; Packaging: Cut Tape; Capacitance: 10uF; Voltage Rating: 16V; RoHS Compliant: Yes; ComponentLink1URL: http://www.yageo.com/documents/recent/UPY-GPHC_X5R_4V-to-50V_25.pdf?src-supplier=Digi-Key; ComponentLink1Description: http://www.yageo.com/documents/recent/UPY-GPHC_X5R_4V-to-50V_25.pdf?src-supplier=Digi-Key; Supplier Part Number 1: 311-3486-1-ND; LCSC Part Number: C2936601
C58 C60 = CC0402KRX5R7BB105: CAP CER 1UF 16V X5R 0402; Manufacturer: Yageo; Tolerance: 10%; Item Type: Capacitor; Supplier 1: Digi-Key; Manufacturer Part Number: CC0402KRX5R7BB105; Stock 1: 1405667; Pricing 1: 1=0.36, 10=0.252, 100=0.1512, 500=0.1134, 1000=0.09576, 2500=0.09072, 5000=0.08568 (USD); Mount: Surface Mount; Case/Package: 0402; Weight: 2.3E-05oz; Case Code (Imperial): 0402; Case Code (Metric): 1005; Min Operating Temperature: -55°C; Max Operating Temperature: 85°C; Capacitance: 1uF; Dielectric: X5R; Packaging: Tape and Reel; Voltage Rating (DC): 16V; Voltage Rating: 16V; Termination: SMD/SMT; Composition: Ceramic; Length: 1mm; Height: 0.5mm; Width: 0.02inch; Thickness: 0.022inch; Depth: 0.5mm; Radiation Hardening: No; Lead Free: Lead Free; Halogen Free: Halogen Free; ComponentLink1URL: http://www.yageo.com/documents/recent/UPY-GPHC_X5R_4V-to-50V_12.pdf?src-supplier=Avnet+Europe; ComponentLink1Description: http://www.yageo.com/documents/recent/UPY-GPHC_X5R_4V-to-50V_12.pdf?src-supplier=Avnet+Europe; Supplier Part Number 1: 311-1691-6-ND; LCSC Part Number: C325464
C59 = CC0402KRX7R9BB473: CAP CER 0.047UF 50V X7R 0402; Manufacturer: Yageo; Material: 4241ConductorMaterial; Tolerance: 10%; Temperature Coefficient: 30ppm/°C; Dielectric: 1511DielectricType; Item Type: Capacitor; Supplier: Future Electronics; Supplier Part Number: 2095687; Manufacturer Part Number: CC0402KRX7R9BB473; RoHS: Yes; Category: Ceramic Capacitors; Stock: 1130000; Pricing: 10000=0.0044, 40000=0.0042, 100000=0.004, 150000=0.0041, 250000=0.0039, 400000=0.0037, 500000=0.0038 (USD); Mounting Technology: Surface Mount; Case/Package: 0402; Case Code (Imperial): 0402; Case Code (Metric): 1005; Min Operating Temperature: -55°C; Max Operating Temperature: 125°C; Packaging: Tape and Reel; Value: 47nF; Voltage Rating: 50V; Series: CC; Voltage Rating (DC): 50V; Length: 0.039inch; Width: 0.02inch; Height: 550um; Thickness: 0.022inch; RoHS Compliant: Yes; Halogen Free: 5694HalogenFree; Lead Free: 5697LeadFree; ComponentLink1URL: https://datasheet.octopart.com/CC0402KRX7R9BB473-Yageo-datasheet-166511530.pdf?src-supplier=Future+Electronics; ComponentLink1Description: https://datasheet.octopart.com/CC0402KRX7R9BB473-Yageo-datasheet-166511530.pdf?src-supplier=Future+Electronics; ComponentLink2URL: http://www.yageo.com/documents/recent/UPY-GPHC_X7R_6.3V-to-50V_18.pdf?src-supplier=Digikey; ComponentLink2Description: http://www.yageo.com/documents/recent/UPY-GPHC_X7R_6.3V-to-50V_18.pdf?src-supplier=Digikey; ComponentLink3URL: https://datasheet.octopart.com/CC0402KRX7R9BB473-Yageo-datasheet-140260305.pdf?src-supplier=Newark; ComponentLink3Description: https://datasheet.octopart.com/CC0402KRX7R9BB473-Yageo-datasheet-140260305.pdf?src-supplier=Newark; LCSC Part Number: C272875
C62-C64 C66-C68 C70-C72 C74 C75 C77 C78 C82-C86 C88 C89 C91 C92 = CC0402KRX5R8BB224: as C33 on sheet Radar_Power_Sheet; Supplier 1: Mouser; Manufacturer Part Number: CC0402KRX5R8BB224; RoHS: Yes; Category: Ceramic Capacitors; Stock 1: 61266; Pricing 1: 1=0.10000, 10=0.03300, 50=0.03300, 100=0.02700, 1000=0.01500, 10000=0.01300 (USD); Mount: Surface Mount; Case/Package: 0402; Min Operating Temperature: -55°C; Max Operating Temperature: 85°C; Packaging: Tape and Reel; Voltage Rating: 25V; Voltage Rating (DC): 25V; Dielectric: X5R; Length: 0.039inch; Width: 0.02inch; Thickness: 0.022inch; Lead Free: Lead Free; Halogen Free: Halogen Free; RoHS Compliant: Yes; ComponentLink1URL: http://www.yageo.com/documents/recent/UPY-GPHC_X5R_4V-to-50V_25.pdf?src-supplier=Digi-Key; ComponentLink1Description: http://www.yageo.com/documents/recent/UPY-GPHC_X5R_4V-to-50V_25.pdf?src-supplier=Digi-Key; ComponentLink2URL: https://www.yageo.com/upload/media/product/productsearch/datasheet/mlcc/UPY-GPHC_X5R_4V-to-50V_26.pdf?src-supplier=Digi-Key; ComponentLink2Description: https://www.yageo.com/upload/media/product/productsearch/datasheet/mlcc/UPY-GPHC_X5R_4V-to-50V_26.pdf?src-supplier=Digi-Key; ComponentLink3URL: http://www.yageo.com/documents/recent/UPY-GPHC_X5R_4V-to-50V_23.pdf?src-supplier=Digi-Key; ComponentLink3Description: http://www.yageo.com/documents/recent/UPY-GPHC_X5R_4V-to-50V_23.pdf?src-supplier=Digi-Key; Supplier Part Number 1: 603-CC402KRX5R8BB224; LCSC Part Number: C326836
C79 C80 = CC0402JRX7R7BB104: CAP CER 0.1UF 16V X7R 0402; Manufacturer: Yageo; Material: 4241ConductorMaterial; Value: 100nF; Tolerance: 5%; Item Type: Capacitor; Supplier: Digikey; Supplier Part Number: 311-1676-1-ND; Manufacturer Part Number: CC0402JRX7R7BB104; RoHS: Yes; Category: Ceramic Capacitors; Stock: 1659111; Pricing: 1=0.1, 10=0.046, 50=0.0262, 100=0.0203, 500=0.01528, 1000=0.012, 2500=0.01091, 5000=0.01004 (USD); Mounting Technology: Surface Mount; Case/Package: 0402; Case Code (Metric): 1005; Case Code (Imperial): 0402; Min Operating Temperature: -55°C; Max Operating Temperature: 125°C; Dielectric: X7R; Packaging: Tape and Reel; Package Quantity: 10000; Voltage Rating (DC): 16V; Voltage Rating: 16V; Series: CC; Construction: Flat; Length: 0.039inch; Width: 0.02inch; Height: 0.5mm; Thickness: 0.022inch; Lead Free: Lead Free; Halogen Free: Halogen Free; RoHS Compliant: Yes; ComponentLink1URL: https://datasheet.ciiva.com/13210/upy-gphc-x7r-6-3v-to-50v-8-12304-13210152.pdf?src-supplier=Mouser; ComponentLink1Description: https://datasheet.ciiva.com/13210/upy-gphc-x7r-6-3v-to-50v-8-12304-13210152.pdf?src-supplier=Mouser; LCSC Part Number: C541464
TP2 = TEST POINT: Test Point ON; Item Type: TEST POINT
U10 = AWR1843ARBGALPQ1: RF System on a Chip - SoC Single-chip 76-GHz to 81-GHz automotive radar sensor integrating antenna on package, DSP and MCU 180-FCCSP -40 to 125; Manufacturer: Texas Instruments; Item Type: IC; Supplier: Mouser; Supplier Part Number: 595-AWR1843ARBGALPQ1; Manufacturer Part Number: AWR1843ARBGALPQ1; RoHS: No; Category: Integrated Circuits (ICs); Stock: 118; Pricing: 1=46.9, 10=43.76, 50=40.61, 100=37.99, 1000=37.99, 10000=37.99 (USD); Case/Package: 107Case; Pins: 180NUMBER; Length: 15mm; Width: 15mm; Height: 965um; Thickness: 965um

## Sheet System_Power_Sheet.SchDoc
size 420 x 297 mm; SheetNumber: 2; SheetTotal: 6
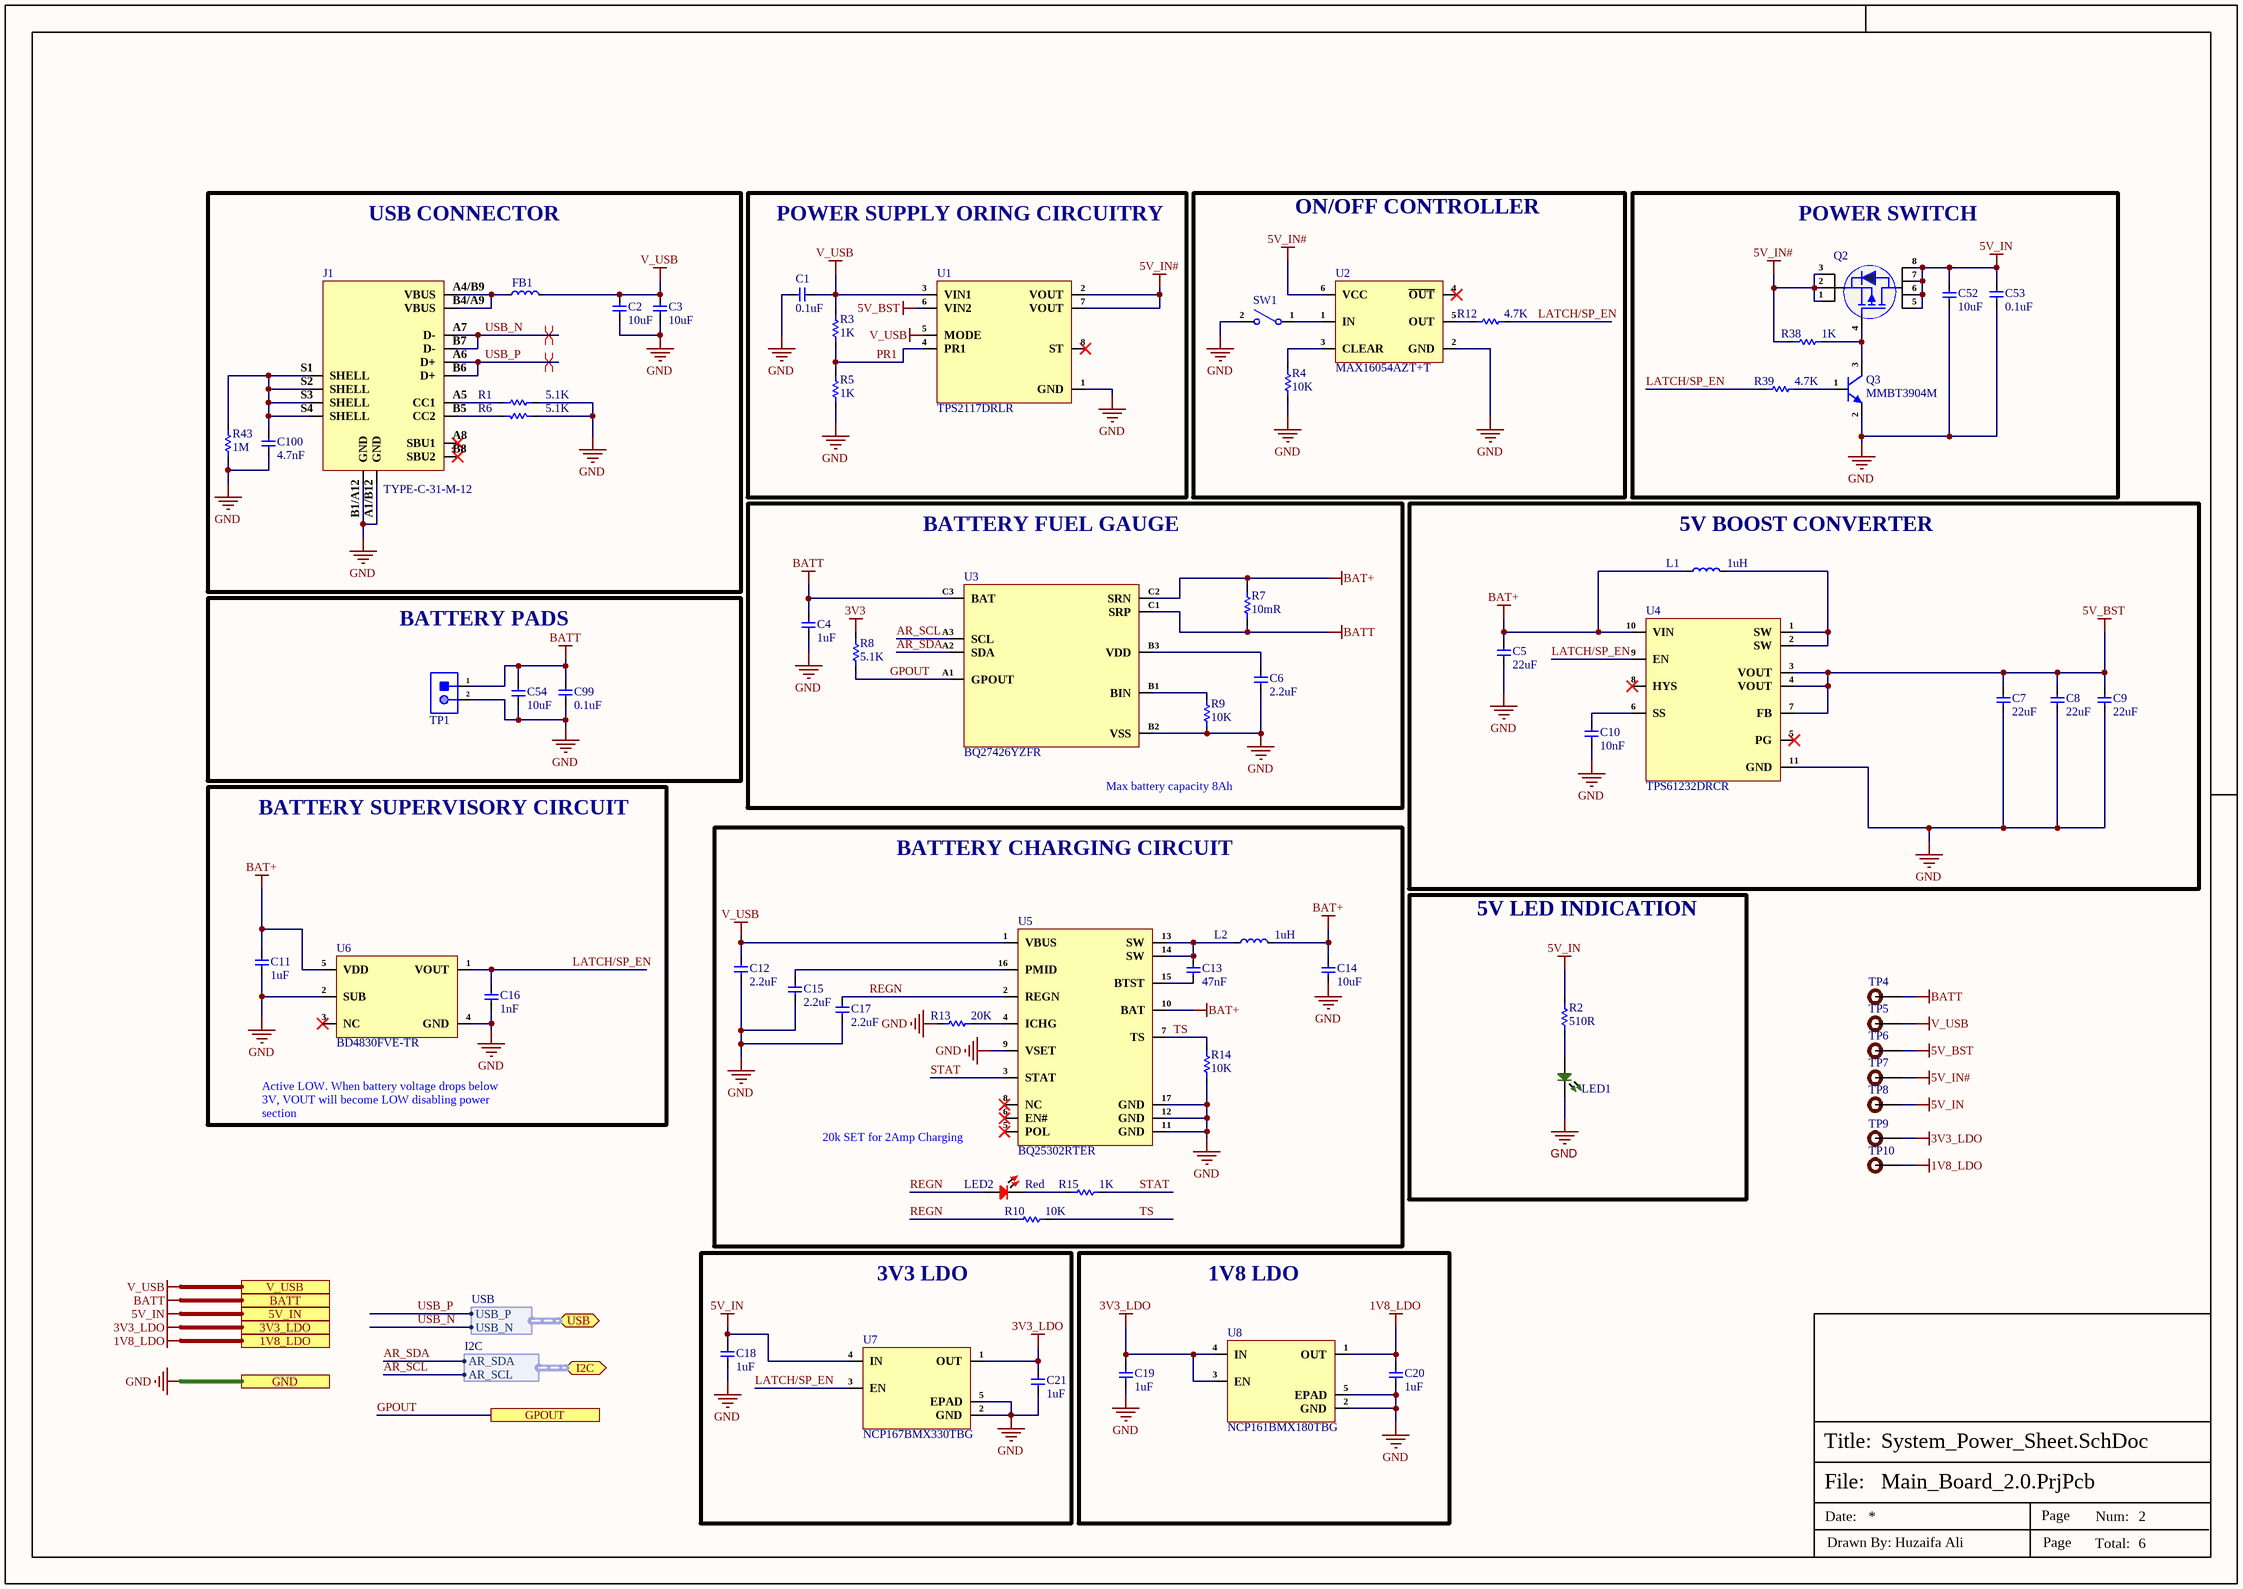
[diagram p3: System_Power_Sheet.SchDoc]

### Parts
C1  0.1uF  [Cap-0402]
C2  10uF  [Cap-0603]
C3  10uF  [Cap-0603]
C4  1uF  [Cap-0402]
C5  22uF  [Cap-0603]
C6  2.2uF  [CAP-0603]
C7  22uF  [Cap-0603]
C8  22uF  [Cap-0603]
C9  22uF  [Cap-0603]
C10  10nF  [Cap-0402]
C11  1uF  [Cap-0402]
C12  2.2uF  [CAP-0603]
C13  47nF  [Cap-0402]
C14  10uF  [Cap-0603]
C15  2.2uF  [CAP-0603]
C16  1nF  [CAP-0201]
C17  2.2uF  [CAP-0603]
C18  1uF  [Cap-0402]
C19  1uF  [Cap-0402]
C20  1uF  [Cap-0402]
C21  1uF  [Cap-0402]
C52  10uF  [Cap-0603]
C53  0.1uF  [Cap-0402]
C54  10uF  [Cap-0603]
C99  0.1uF  [Cap-0402]
C100  4.7nF  [Cap-1206]
FB1  100MHz  [IND-1206]  (value not drawn)
J1  TYPE-C-31-M-12  [TYPE-C-31-M-12_]
L1  1uH  [WPN4020H1R0MT_]
L2  1uH  [WPN4020H1R0MT_]
LED1  XZVG68W-2  [LED-0402]  (value not drawn)
LED2  Red  [LED-0402]
Q2  IRF7410TRPBF  [SOP-8]  (value not drawn)
Q3  MMBT3904M  [SOT-723]
R1  5.1K  [Res-0402]
R2  510R  [Res-0402]
R3  1K  [Res-0201]
R4  10K  [Res-0402]
R5  1K  [Res-0201]
R6  5.1K  [Res-0402]
R7  10mR  [Res-1206]
R8  5.1K  [Res-0402]
R9  10K  [Res-0402]
R10  10K  [Res-0402]
R12  4.7K  [Res-0402]
R13  20K  [Res-0603]
R14  10K  [Res-0402]
R15  1K  [Res-0201]
R38  1K  [Res-0201]
R39  4.7K  [Res-0402]
R43  1M  [Res-0603]
SW1  EVQ-P7A01P  [EVQP7A01P]  (value not drawn)
TP1  2 Test Pad  [2 Test Pad]  (value not drawn)  (no BOM)
TP4  TEST POINT  [Test-point]  (value not drawn)  (no BOM)
TP5  TEST POINT  [Test-point]  (value not drawn)  (no BOM)
TP6  TEST POINT  [Test-point]  (value not drawn)  (no BOM)
TP7  TEST POINT  [Test-point]  (value not drawn)  (no BOM)
TP8  TEST POINT  [Test-point]  (value not drawn)  (no BOM)
TP9  TEST POINT  [Test-point]  (value not drawn)  (no BOM)
TP10  TEST POINT  [Test-point]  (value not drawn)  (no BOM)
U1  TPS2117DRLR  [SOT-583]
U2  MAX16054AZT+T  [TSOT-23-6]
U3  BQ27426YZFR  [DSBGA-9 (1.651x1.61)]
U4  TPS61232DRCR  [10-VSON (3x3)]
U5  BQ25302RTER  [16-QFN (3x3).]
U6  BD4830FVE-TR  [5-VSOF]
U7  NCP167BMX330TBG  [4-UDFN (1.0x1.0)]
U8  NCP161BMX180TBG  [4-UDFN (1.0x1.0)]

### Blocks framed on the sheet
USB CONNECTOR: C2 C3 C100 FB1 J1 R1 R6 R43
POWER SUPPLY ORING CIRCUITRY: C1 R3 R5 U1
ON/OFF CONTROLLER: R4 R12 SW1 U2
POWER SWITCH: C52 C53 Q2 Q3 R38 R39
BATTERY FUEL GAUGE: C4 C6 R7-R9 U3
5V BOOST CONVERTER: C5 C7-C10 L1 U4
BATTERY PADS: C54 C99 TP1
BATTERY SUPERVISORY CIRCUIT: C11 C16 U6
BATTERY CHARGING CIRCUIT: C12-C15 C17 L2 LED2 R10 R13-R15 U5
5V LED INDICATION: LED1 R2
3V3 LDO: C18 C21 U7
1V8 LDO: C19 C20 U8

### Ports
1V8_LDO, 3V3_LDO, 5V_IN, BATT, GND, GPOUT, I2C (bidir, harness I2C), USB (bidir, harness USB), V_USB

### Harnesses
USB: USB_P, USB_N
I2C: AR_SDA, AR_SCL

### Nets
1V8_LDO: C20.2 TP10.1 U8.1(OUT) ; port 1V8_LDO
3V3: R8.2
3V3_LDO: C19.2 C21.2 TP9.1 U7.1(OUT) U8.3(EN) U8.4(IN) ; port 3V3_LDO
5V_BST: C7.2 C8.2 C9.2 TP6.1 U1.6(VIN2) U4.3(VOUT) U4.4(VOUT) U4.7(FB)
5V_IN: C18.1 C52.2 C53.1 Q2.5(D) Q2.6(D) Q2.7(D) Q2.8(D) R2.2 TP8.1 U7.4(IN) ; port 5V_IN
5V_IN#: Q2.1(S) Q2.2(S) Q2.3(S) R38.2 TP7.1 U1.2(VOUT) U1.7(VOUT) U2.6(VCC)
BAT+: C5.2 C11.1 C14.2 L1.1 L2.2 R7.2 U3.C2(SRN) U4.10(VIN) U5.10(BAT) U6.5(VDD)
BATT: C4.1 C54.2 C99.1 R7.1 TP1.1 TP4.1 U3.C1(SRP) U3.C3(BAT) ; port BATT
GND: C1.2 C2.1 C3.1 C4.2 C5.1 C6.1 C7.1 C8.1 C9.1 C10.1 C11.2 C12.2 C14.1 C15.2 C16.1 C17.2 C18.2 C19.1 C20.1 C21.1 C52.1 C53.2 C54.1 C99.2 C100.1 J1.A1/B12(GND) J1.B1/A12(GND) LED1.2 Q3.2(E) R1.1 R4.1 R5.1 R6.1 R9.1 R13.1 R14.1 R43.1 SW1.2 TP1.2 U1.1(GND) U2.2(GND) U3.B2(VSS) U4.11(GND) U5.9(VSET) U5.11(GND) U5.12(GND) U5.17(GND) U6.2(SUB) U6.4(GND) U7.2(GND) U7.5(EPAD) U8.2(GND) U8.5(EPAD) ; port GND
V_USB: C1.1 C2.2 C3.2 C12.1 FB1.2 R3.2 TP5.1 U1.3(VIN1) U1.5(MODE) U5.1(VBUS) ; port V_USB
AR_SCL: U3.A3(SCL) ; port I2C.AR_SCL
AR_SDA: U3.A2(SDA) ; port I2C.AR_SDA
GPOUT: R8.1 U3.A1(GPOUT) ; port GPOUT
LATCH/SP_EN: C16.2 R12.1 R39.2 U4.9(EN) U6.1(VOUT) U7.3(EN)
PR1: R3.1 R5.2 U1.4(PR1)
REGN: C17.1 LED2.1 R10.2 U5.2(REGN)
STAT: R15.1 U5.3(STAT)
TS: R10.1 R14.2 U5.7(TS)
USB_N: J1.A7(D-) J1.B7(D-) ; port USB.USB_N
USB_P: J1.A6(D+) J1.B6(D+) ; port USB.USB_P
NetC6_2: C6.2 U3.B3(VDD)
NetC10_2: C10.2 U4.6(SS)
NetC13_1: C13.1 U5.15(BTST)
NetC13_2: C13.2 L2.1 U5.13(SW) U5.14(SW)
NetC15_1: C15.1 U5.16(PMID)
NetC100_2: C100.2 J1.S1(SHELL) J1.S2(SHELL) J1.S3(SHELL) J1.S4(SHELL) R43.2
NetFB1_1: FB1.1 J1.A4/B9(VBUS) J1.B4/A9(VBUS)
NetJ1_A5: J1.A5(CC1) R1.2
NetJ1_B5: J1.B5(CC2) R6.2
NetL1_2: L1.2 U4.1(SW) U4.2(SW)
NetLED1_1: LED1.1 R2.1
NetLED2_2: LED2.2 R15.2
NetQ2_4: Q2.4(G) Q3.3(C) R38.1
NetQ3_1: Q3.1(B) R39.1
NetR4_2: R4.2 U2.3(CLEAR)
NetR9_2: R9.2 U3.B1(BIN)
NetR12_2: R12.2 U2.5(OUT)
NetR13_2: R13.2 U5.4(ICHG)
NetSW1_1: SW1.1 U2.1(IN)

Not connected (* = marked no-connect by the designer): J1 A8(SBU1)* B8(SBU2)*; U1 8(ST)*; U2 4(~{OUT})*; U4 5(PG)* 8(HYS)*; U5 5(POL)* 6(EN#)* 8(NC)*; U6 3(NC)*

### Layout directives
differential pair; net class USB; differential pair class USB_Lines; rule Impedance Constraint [Min = 88.00    Max = 90.00    ]; rule Matched Net Lengths [Tolerance = 20mil]: USB_N, USB_P

### Notes on the sheet
- Max battery capacity 8Ah
- Active LOW. When battery voltage drops below 3V, VOUT will become LOW disabling power section
- 20k SET for 2Amp Charging
- File:
- Title:
- Date:
- Page
- Num:
- Total:
- Drawn By: Huzaifa Ali